# Altium schematic sheet 智能家居.SchDoc
size A4
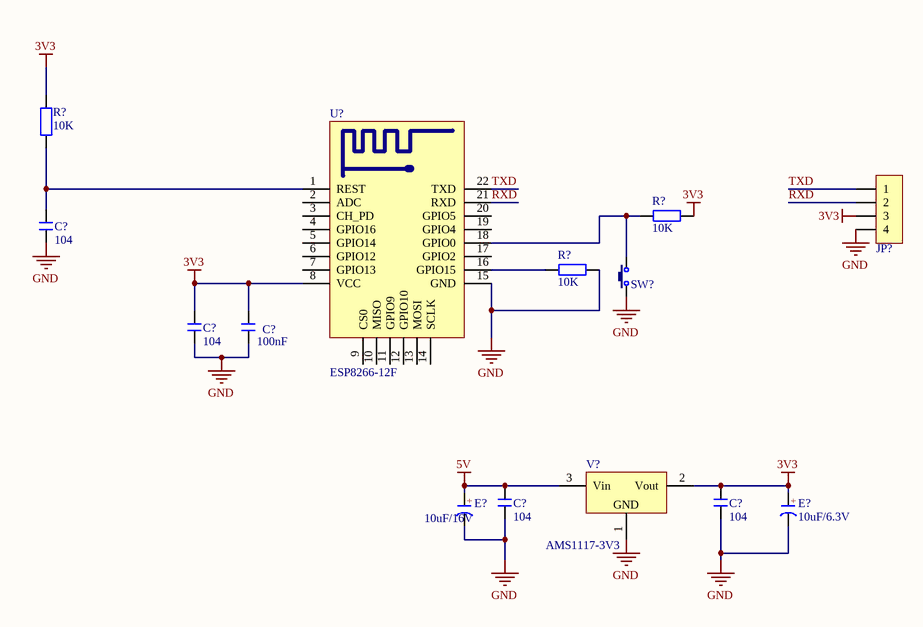
[diagram p0: 智能家居.SchDoc]

## Parts
(Parts that share a designator on the sheet are numbered #1, #2 ... from top to bottom, then left to right.)
C?#1  104  [C 0603_L]
C?#2  104  [C 0603_L]
C?#3  100nF  [C 0805_L]
C?#4  104  [C 0603_L]
C?#5  104  [C 0603_L]
E?#1  10uF/16V  [CD A(3216)]
E?#2  10uF/6.3V  [CD A(3216)]
JP?  HDR-1X4  [XH2.54-WI-4P]  (value not drawn)
R?#1  10K  [R 0603_L]
R?#2  10K  [R 0603_L]
R?#3  10K  [R 0603_L]
SW?  3x6x5  [TSW SMD-3*6*2.5]  (value not drawn)
U?  ESP8266-12F  [ESP_12E]
V?  AMS1117-3V3  [SOT223_L]

## Nets
3V3: C?#2.1 C?#3.1 C?#5.1 E?#2.1(A) JP?.3 R?#1.2 R?#2.2 U?.8(VCC) V?.2(Vout)
5V: C?#4.1 E?#1.1(A) V?.3(Vin)
GND: C?#1.1 C?#2.2 C?#3.2 C?#4.2 C?#5.2 E?#1.2(K) E?#2.2(K) JP?.4 R?#3.1 SW?.1 U?.15(GND) V?.1(GND)
RXD: JP?.2 U?.21(RXD)
TXD: JP?.1 U?.22(TXD)
NetC?#1_2: C?#1.2 R?#1.1 U?.1(REST)
NetR?#2_1: R?#2.1 SW?.2 U?.18(GPIO0)
NetR?#3_2: R?#3.2 U?.16(GPIO15)

Not connected (* = marked no-connect by the designer): U? 2(ADC) 3(CH_PD) 4(GPIO16) 5(GPIO14) 6(GPIO12) 7(GPIO13) 9(CS0) 10(MISO) 11(GPIO9) 12(GPIO10) 13(MOSI) 14(SCLK) 17(GPIO2) 19(GPIO4) 20(GPIO5)

## Notes on the sheet
- (in symbol CT) +

## Library data of the parts
C?#1-C?#5 = C: 贴片电容; BOM名称: 无极性贴片电容; 淘宝ID: 封装库来自淘宝 ID：黄晶宝石; 联系售后，技术支持: https://shop463601444.taobao.com; 唯一出售店铺网址: https://shop463601444.taobao.com
E?#1 E?#2 = CT: 贴片钽电容; 淘宝ID: 封装库来自淘宝 ID：黄晶宝石; BOM名称: 贴片钽电容; 联系售后: https://shop463601444.taobao.com
JP? = Header 4: 4P接插件; 版权归属: 封装库来自淘宝 ID：黄晶宝石; BOM名称: 4P接插件; 学习资源: https://shop463601444.taobao.com
R?#1-R?#3 = R: 贴片电阻; 版权归属: 来自淘宝 ID：黄晶宝石; 封装库来自淘宝卖家 ID：黄晶宝石: 其他店铺购入均为盗版，不享受售后技术支持服务，请立即申请退款; BOM名称: 贴片电阻; 联系售后: https://shop463601444.taobao.com
SW? = TSW 3x6: 3x6轻触开关; 版权归属: 封装库来自淘宝 ID：黄晶宝石; BOM名称: 3x6轻触开关; 学习资源: https://shop463601444.taobao.com
U? = ESP8266-12E: 串口 WIFI模块，ESP-12E; BOM名称: WIFI模块; 版权归属: 封装库来自淘宝 ID：黄晶宝石; 学习资源: https://shop463601444.taobao.com
V? = AMS1117: 三端稳压芯片; BOM名称: 稳压芯片; 淘宝ID: 封装库来自淘宝 ID：黄晶宝石; 欢迎光临淘宝店铺: https://shop463601444.taobao.com